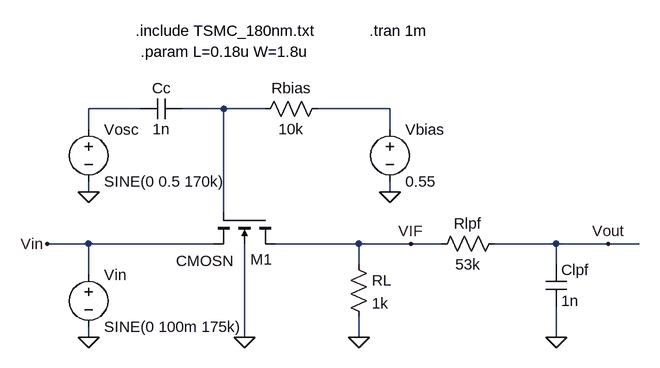
[diagram p0: schematic Switch_Mixer_Design.asc]
Switch_Mixer_Design.asc, the LTspice schematic file:
Version 4.1
SHEET 1 2100 680
WIRE 448 128 368 128
WIRE 576 128 512 128
WIRE 640 128 576 128
WIRE 832 128 720 128
WIRE 368 160 368 128
WIRE 832 160 832 128
WIRE 368 256 368 240
WIRE 832 256 832 240
WIRE 576 288 576 128
WIRE 368 336 304 336
WIRE 560 336 368 336
WIRE 784 336 656 336
WIRE 864 336 784 336
WIRE 912 336 864 336
WIRE 1088 336 992 336
WIRE 1168 336 1088 336
WIRE 1216 336 1168 336
WIRE 784 368 784 336
WIRE 1088 368 1088 336
WIRE 368 384 368 336
WIRE 368 480 368 464
WIRE 608 480 608 336
WIRE 784 480 784 448
WIRE 1088 480 1088 432
FLAG 368 480 0
FLAG 608 480 0
FLAG 784 480 0
FLAG 832 256 0
FLAG 368 256 0
FLAG 864 336 VIF
FLAG 304 336 Vin
FLAG 1088 480 0
FLAG 1168 336 Vout
SYMBOL nmos4 656 288 R90
WINDOW 0 72 5 VRight 2
WINDOW 3 74 64 VRight 2
SYMATTR InstName M1
SYMATTR Value CMOSN
SYMATTR Value2 l=L w=W ad=5*L*W/2 as=5*L*W/2 pd=5*L+2*W ps=5*L+2*W
SYMBOL res 768 352 R0
SYMATTR InstName RL
SYMATTR Value 1k
SYMBOL voltage 368 368 R0
WINDOW 123 0 0 Left 0
WINDOW 39 0 0 Left 0
SYMATTR InstName Vin
SYMATTR Value SINE(0 100m 175k)
SYMBOL res 736 112 R90
WINDOW 0 0 56 VBottom 2
WINDOW 3 32 56 VTop 2
SYMATTR InstName Rbias
SYMATTR Value 10k
SYMBOL voltage 832 144 R0
SYMATTR InstName Vbias
SYMATTR Value 0.55
SYMBOL cap 512 112 R90
WINDOW 0 0 32 VBottom 2
WINDOW 3 32 32 VTop 2
SYMATTR InstName Cc
SYMATTR Value 1n
SYMBOL voltage 368 144 R0
WINDOW 123 0 0 Left 0
WINDOW 39 0 0 Left 0
SYMATTR InstName Vosc
SYMATTR Value SINE(0 0.5 170k)
SYMBOL res 1008 320 R90
WINDOW 0 0 56 VBottom 2
WINDOW 3 32 56 VTop 2
SYMATTR InstName Rlpf
SYMATTR Value 53k
SYMBOL cap 1072 368 R0
SYMATTR InstName Clpf
SYMATTR Value 1n
TEXT 440 8 Left 2 !.include TSMC_180nm.txt
TEXT 448 40 Left 2 !.param L=0.18u W=1.8u
TEXT 800 8 Left 2 !.tran 1m

The netlist it stands for:
* Switch_Mixer_Design.asc
M1 VIF N002 Vin 0 CMOSN l=L w=W ad=5*L*W/2 as=5*L*W/2 pd=5*L+2*W ps=5*L+2*W
RL VIF 0 1k
Vin Vin 0 SINE(0 100m 175k)
Rbias N003 N002 10k
Vbias N003 0 0.55
Cc N002 N001 1n
Vosc N001 0 SINE(0 0.5 170k)
Rlpf Vout VIF 53k
Clpf Vout 0 1n
.model NMOS NMOS
.model PMOS PMOS
.lib standard.mos
.include TSMC_180nm.txt
.param L=0.18u W=1.8u
.tran 1m
.backanno
.end